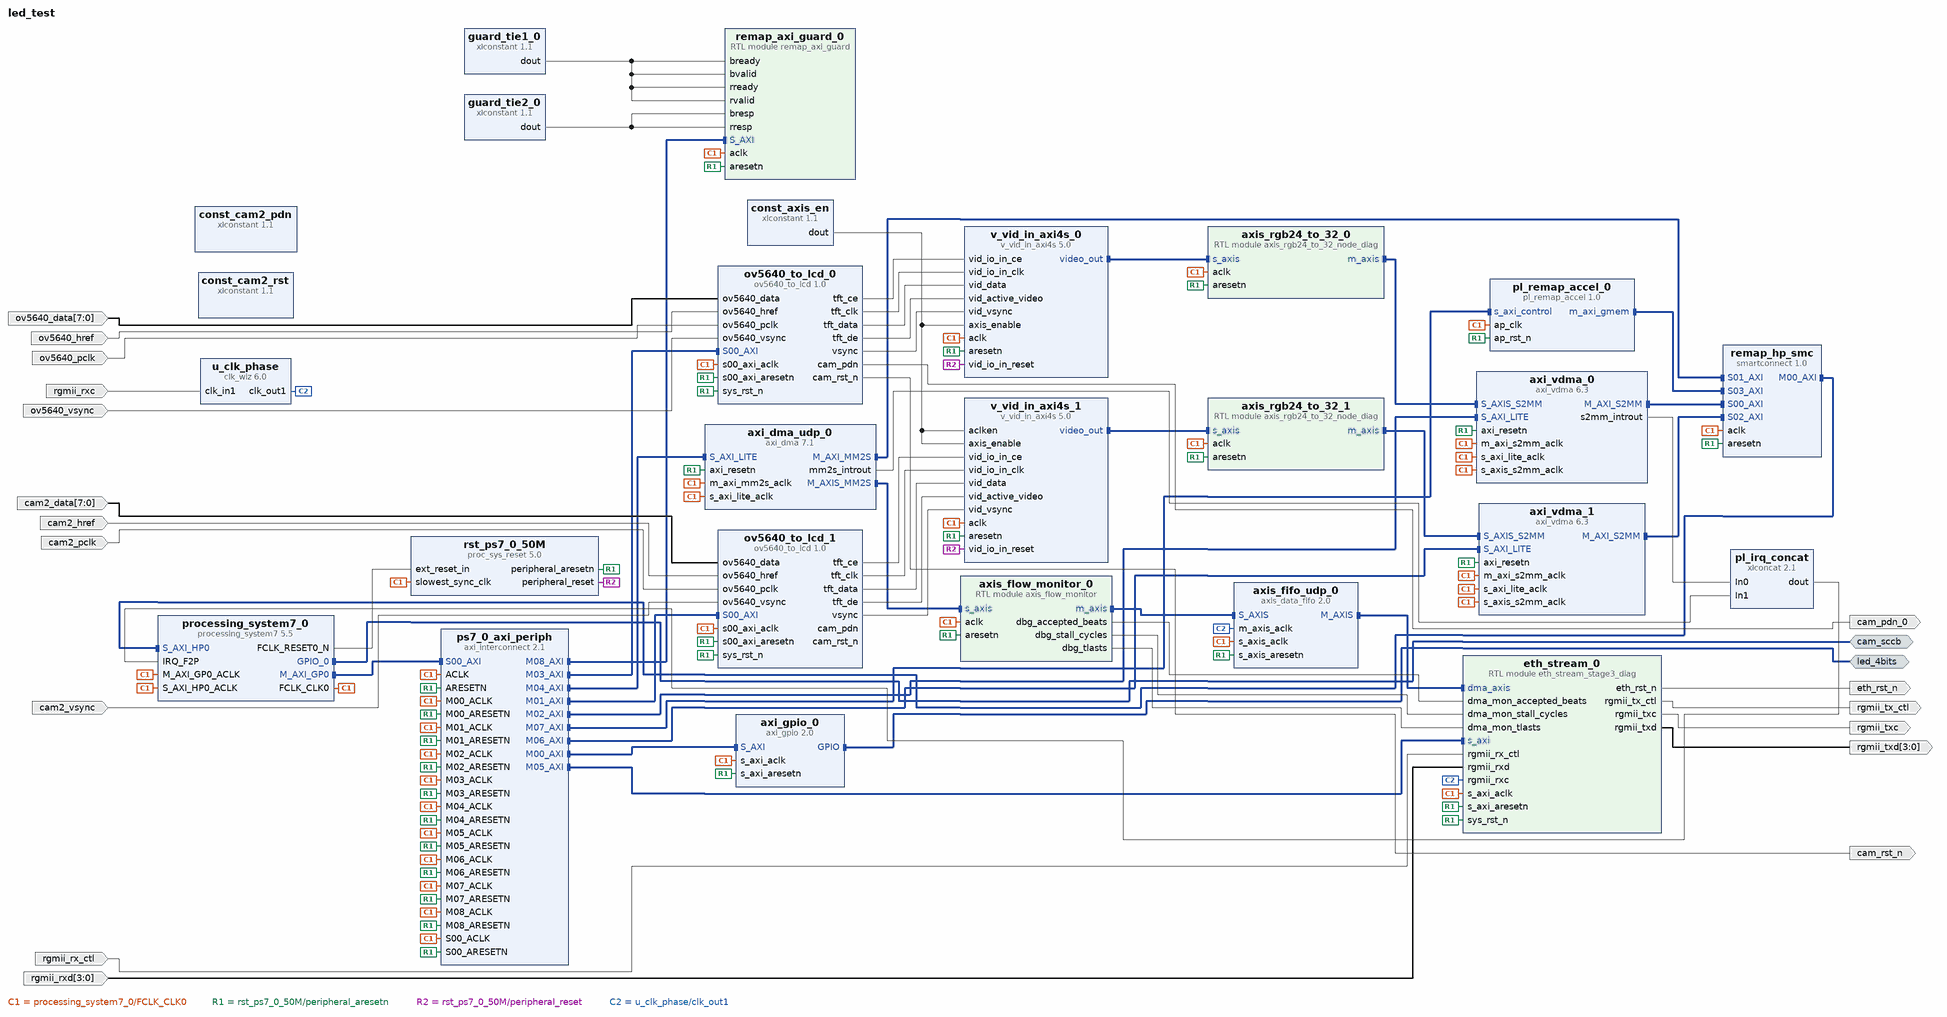
[diagram p0: block diagram of the top level]
# Vivado block design led_test, xc7z020clg400-2, Vivado 2024.1
create_bd_design led_test

create_bd_intf_port -mode Master -vlnv xilinx.com:interface:gpio_rtl:1.0 led_4bits
create_bd_intf_port -mode Master -vlnv xilinx.com:interface:gpio_rtl:1.0 cam_sccb
create_bd_port -dir I -type clk ov5640_pclk
create_bd_port -dir I ov5640_href
create_bd_port -dir I ov5640_vsync
create_bd_port -dir I -from 7 -to 0 ov5640_data
create_bd_port -dir O cam_rst_n
create_bd_port -dir O cam_pdn_0
create_bd_port -dir I -type clk rgmii_rxc
set_property -dict {CONFIG.FREQ_HZ 125000000} [get_bd_ports rgmii_rxc]
create_bd_port -dir I rgmii_rx_ctl
create_bd_port -dir I -from 3 -to 0 rgmii_rxd
create_bd_port -dir O rgmii_txc
create_bd_port -dir O rgmii_tx_ctl
create_bd_port -dir O -from 3 -to 0 rgmii_txd
create_bd_port -dir O eth_rst_n
create_bd_port -dir I -from 7 -to 0 cam2_data
create_bd_port -dir I cam2_pclk
create_bd_port -dir I cam2_vsync
create_bd_port -dir I cam2_href

create_bd_cell -type ip -vlnv xilinx.com:ip:processing_system7:5.5 processing_system7_0
set_property -dict [list \
  CONFIG.PCW_ENET0_ENET0_IO {MIO 16 .. 27} \
  CONFIG.PCW_ENET0_GRP_MDIO_ENABLE 1 \
  CONFIG.PCW_ENET0_GRP_MDIO_IO {MIO 52 .. 53} \
  CONFIG.PCW_ENET0_PERIPHERAL_ENABLE 1 \
  CONFIG.PCW_FPGA0_PERIPHERAL_FREQMHZ 100 \
  CONFIG.PCW_GPIO_EMIO_GPIO_ENABLE 1 \
  CONFIG.PCW_GPIO_EMIO_GPIO_IO 4 \
  CONFIG.PCW_GPIO_EMIO_GPIO_WIDTH 4 \
  CONFIG.PCW_GPIO_MIO_GPIO_ENABLE 0 \
  CONFIG.PCW_IRQ_F2P_INTR 1 \
  CONFIG.PCW_PRESET_BANK1_VOLTAGE {LVCMOS 1.8V} \
  CONFIG.PCW_QSPI_GRP_SINGLE_SS_ENABLE 1 \
  CONFIG.PCW_QSPI_GRP_SINGLE_SS_IO {MIO 1 .. 6} \
  CONFIG.PCW_QSPI_PERIPHERAL_ENABLE 1 \
  CONFIG.PCW_QSPI_QSPI_IO {MIO 1 .. 6} \
  CONFIG.PCW_SD0_GRP_CD_ENABLE 1 \
  CONFIG.PCW_SD0_GRP_CD_IO {MIO 12} \
  CONFIG.PCW_SD0_GRP_WP_ENABLE 0 \
  CONFIG.PCW_SD0_PERIPHERAL_ENABLE 1 \
  CONFIG.PCW_SD0_SD0_IO {MIO 40 .. 45} \
  CONFIG.PCW_SDIO_PERIPHERAL_FREQMHZ 100 \
  CONFIG.PCW_SINGLE_QSPI_DATA_MODE x4 \
  CONFIG.PCW_UART0_PERIPHERAL_ENABLE 1 \
  CONFIG.PCW_UART0_UART0_IO {MIO 14 .. 15} \
  CONFIG.PCW_UART_PERIPHERAL_FREQMHZ 100 \
  CONFIG.PCW_UIPARAM_DDR_PARTNO {MT41K256M16 RE-125} \
  CONFIG.PCW_USB0_PERIPHERAL_ENABLE 0 \
  CONFIG.PCW_USE_FABRIC_INTERRUPT 1 \
  CONFIG.PCW_USE_S_AXI_HP0 1 \
] [get_bd_cells processing_system7_0]
# 137 more settings of processing_system7_0 are not shown: defaults, MIO pin electricals, DDR timing, and values the tool derives
create_bd_cell -type ip -vlnv xilinx.com:ip:axi_gpio:2.0 axi_gpio_0
set_property -dict {CONFIG.C_ALL_OUTPUTS 1 CONFIG.C_GPIO_WIDTH 4} [get_bd_cells axi_gpio_0]
create_bd_cell -type ip -vlnv xilinx.com:ip:axi_interconnect:2.1 ps7_0_axi_periph
set_property -dict {CONFIG.NUM_MI 9} [get_bd_cells ps7_0_axi_periph]
create_bd_cell -type ip -vlnv xilinx.com:ip:proc_sys_reset:5.0 rst_ps7_0_50M
create_bd_cell -type ip -vlnv xilinx.com:ip:smartconnect:1.0 remap_hp_smc
set_property -dict {CONFIG.NUM_MI 1 CONFIG.NUM_SI 4} [get_bd_cells remap_hp_smc]
create_bd_cell -type ip -vlnv xilinx.com:user:ov5640_to_lcd:1.0 ov5640_to_lcd_0
create_bd_cell -type ip -vlnv xilinx.com:ip:v_vid_in_axi4s:5.0 v_vid_in_axi4s_0
set_property -dict {CONFIG.C_ADDR_WIDTH 12 CONFIG.C_HAS_ASYNC_CLK 1} [get_bd_cells v_vid_in_axi4s_0]
create_bd_cell -type ip -vlnv xilinx.com:ip:xlconstant:1.1 const_axis_en
set_property -dict {CONFIG.CONST_VAL 1 CONFIG.CONST_WIDTH 1} [get_bd_cells const_axis_en]
create_bd_cell -type ip -vlnv xilinx.com:ip:axi_vdma:6.3 axi_vdma_0
set_property -dict [list \
  CONFIG.c_include_internal_genlock 0 \
  CONFIG.c_include_mm2s 0 \
  CONFIG.c_include_s2mm 1 \
  CONFIG.c_num_fstores 3 \
  CONFIG.c_s2mm_genlock_mode 0 \
  CONFIG.c_s2mm_genlock_repeat_en 0 \
  CONFIG.c_s2mm_linebuffer_depth 2048 \
  CONFIG.c_s2mm_max_burst_length 64 \
] [get_bd_cells axi_vdma_0]
create_bd_cell -type ip -vlnv xilinx.com:ip:axi_dma:7.1 axi_dma_udp_0
set_property -dict [list \
  CONFIG.c_include_mm2s 1 \
  CONFIG.c_include_s2mm 0 \
  CONFIG.c_include_sg 0 \
  CONFIG.c_m_axi_mm2s_data_width 64 \
  CONFIG.c_m_axis_mm2s_tdata_width 64 \
  CONFIG.c_sg_length_width 23 \
] [get_bd_cells axi_dma_udp_0]
create_bd_cell -type module -reference axis_flow_monitor axis_flow_monitor_0
create_bd_cell -type ip -vlnv xilinx.com:ip:axis_data_fifo:2.0 axis_fifo_udp_0
set_property -dict [list \
  CONFIG.FIFO_DEPTH 2048 \
  CONFIG.HAS_TKEEP 1 \
  CONFIG.HAS_TLAST 1 \
  CONFIG.IS_ACLK_ASYNC 1 \
  CONFIG.TDATA_NUM_BYTES 8 \
] [get_bd_cells axis_fifo_udp_0]
create_bd_cell -type module -reference eth_stream_stage3_diag eth_stream_0
create_bd_cell -type ip -vlnv xilinx.com:ip:clk_wiz:6.0 u_clk_phase
set_property -dict [list \
  CONFIG.CLKOUT1_REQUESTED_OUT_FREQ 125 \
  CONFIG.CLKOUT1_REQUESTED_PHASE 0.0 \
  CONFIG.PRIM_IN_FREQ 125 \
  CONFIG.USE_LOCKED false \
  CONFIG.USE_RESET false \
] [get_bd_cells u_clk_phase]
create_bd_cell -type ip -vlnv xilinx.com:ip:xlconcat:2.1 pl_irq_concat
set_property -dict {CONFIG.NUM_PORTS 2} [get_bd_cells pl_irq_concat]
create_bd_cell -type module -reference axis_rgb24_to_32_node_diag axis_rgb24_to_32_0
create_bd_cell -type ip -vlnv xilinx.com:user:ov5640_to_lcd:1.0 ov5640_to_lcd_1
create_bd_cell -type ip -vlnv xilinx.com:ip:v_vid_in_axi4s:5.0 v_vid_in_axi4s_1
set_property -dict {CONFIG.C_HAS_ASYNC_CLK 1} [get_bd_cells v_vid_in_axi4s_1]
create_bd_cell -type ip -vlnv xilinx.com:ip:axi_vdma:6.3 axi_vdma_1
set_property -dict [list \
  CONFIG.c_include_internal_genlock 0 \
  CONFIG.c_include_mm2s 0 \
  CONFIG.c_include_s2mm 1 \
  CONFIG.c_num_fstores 3 \
  CONFIG.c_s2mm_genlock_mode 0 \
  CONFIG.c_s2mm_genlock_repeat_en 0 \
  CONFIG.c_s2mm_linebuffer_depth 2048 \
  CONFIG.c_s2mm_max_burst_length 64 \
] [get_bd_cells axi_vdma_1]
create_bd_cell -type ip -vlnv xilinx.com:ip:xlconstant:1.1 const_cam2_rst
set_property -dict {CONFIG.CONST_VAL 1 CONFIG.CONST_WIDTH 1} [get_bd_cells const_cam2_rst]
create_bd_cell -type ip -vlnv xilinx.com:ip:xlconstant:1.1 const_cam2_pdn
set_property -dict {CONFIG.CONST_VAL 0 CONFIG.CONST_WIDTH 1} [get_bd_cells const_cam2_pdn]
create_bd_cell -type module -reference axis_rgb24_to_32_node_diag axis_rgb24_to_32_1
create_bd_cell -type ip -vlnv xilinx.com:hls:pl_remap_accel:1.0 pl_remap_accel_0
create_bd_cell -type module -reference remap_axi_guard remap_axi_guard_0
create_bd_cell -type ip -vlnv xilinx.com:ip:xlconstant:1.1 guard_tie1_0
set_property -dict {CONFIG.CONST_VAL 0 CONFIG.CONST_WIDTH 1} [get_bd_cells guard_tie1_0]
create_bd_cell -type ip -vlnv xilinx.com:ip:xlconstant:1.1 guard_tie2_0
set_property -dict {CONFIG.CONST_VAL 0 CONFIG.CONST_WIDTH 2} [get_bd_cells guard_tie2_0]

# ---- connections ----

connect_bd_intf_net [get_bd_intf_pins axi_dma_udp_0/M_AXIS_MM2S] [get_bd_intf_pins axis_flow_monitor_0/s_axis]
connect_bd_intf_net [get_bd_intf_pins axi_dma_udp_0/M_AXI_MM2S] [get_bd_intf_pins remap_hp_smc/S01_AXI]
connect_bd_intf_net [get_bd_intf_ports led_4bits] [get_bd_intf_pins axi_gpio_0/GPIO]
connect_bd_intf_net [get_bd_intf_pins axi_vdma_0/M_AXI_S2MM] [get_bd_intf_pins remap_hp_smc/S00_AXI]
connect_bd_intf_net [get_bd_intf_pins axis_fifo_udp_0/M_AXIS] [get_bd_intf_pins eth_stream_0/dma_axis]
connect_bd_intf_net [get_bd_intf_pins axis_flow_monitor_0/m_axis] [get_bd_intf_pins axis_fifo_udp_0/S_AXIS]
connect_bd_intf_net [get_bd_intf_pins axis_rgb24_to_32_0/m_axis] [get_bd_intf_pins axi_vdma_0/S_AXIS_S2MM]
connect_bd_intf_net [get_bd_intf_pins axis_rgb24_to_32_1/m_axis] [get_bd_intf_pins axi_vdma_1/S_AXIS_S2MM]
connect_bd_intf_net [get_bd_intf_pins pl_remap_accel_0/m_axi_gmem] [get_bd_intf_pins remap_hp_smc/S03_AXI]
connect_bd_intf_net [get_bd_intf_ports cam_sccb] [get_bd_intf_pins processing_system7_0/GPIO_0]
connect_bd_intf_net [get_bd_intf_pins processing_system7_0/M_AXI_GP0] [get_bd_intf_pins ps7_0_axi_periph/S00_AXI]
connect_bd_intf_net [get_bd_intf_pins ps7_0_axi_periph/M00_AXI] [get_bd_intf_pins axi_gpio_0/S_AXI]
connect_bd_intf_net [get_bd_intf_pins ov5640_to_lcd_1/S00_AXI] [get_bd_intf_pins ps7_0_axi_periph/M01_AXI]
connect_bd_intf_net [get_bd_intf_pins ps7_0_axi_periph/M02_AXI] [get_bd_intf_pins axi_vdma_0/S_AXI_LITE]
connect_bd_intf_net [get_bd_intf_pins ps7_0_axi_periph/M03_AXI] [get_bd_intf_pins ov5640_to_lcd_0/S00_AXI]
connect_bd_intf_net [get_bd_intf_pins ps7_0_axi_periph/M04_AXI] [get_bd_intf_pins axi_dma_udp_0/S_AXI_LITE]
connect_bd_intf_net [get_bd_intf_pins ps7_0_axi_periph/M05_AXI] [get_bd_intf_pins eth_stream_0/s_axi]
connect_bd_intf_net [get_bd_intf_pins axi_vdma_1/S_AXI_LITE] [get_bd_intf_pins ps7_0_axi_periph/M06_AXI]
connect_bd_intf_net [get_bd_intf_pins ps7_0_axi_periph/M07_AXI] [get_bd_intf_pins pl_remap_accel_0/s_axi_control]
connect_bd_intf_net [get_bd_intf_pins ps7_0_axi_periph/M08_AXI] [get_bd_intf_pins remap_axi_guard_0/S_AXI]
connect_bd_intf_net -intf_net remap_accel_0_m_axi_gmem2 [get_bd_intf_pins axi_vdma_1/M_AXI_S2MM] [get_bd_intf_pins remap_hp_smc/S02_AXI]
connect_bd_intf_net [get_bd_intf_pins remap_hp_smc/M00_AXI] [get_bd_intf_pins processing_system7_0/S_AXI_HP0]
connect_bd_intf_net [get_bd_intf_pins v_vid_in_axi4s_0/video_out] [get_bd_intf_pins axis_rgb24_to_32_0/s_axis]
connect_bd_intf_net [get_bd_intf_pins v_vid_in_axi4s_1/video_out] [get_bd_intf_pins axis_rgb24_to_32_1/s_axis]
connect_bd_net [get_bd_pins axi_dma_udp_0/mm2s_introut] [get_bd_pins pl_irq_concat/In1]
connect_bd_net [get_bd_pins axi_vdma_0/s2mm_introut] [get_bd_pins pl_irq_concat/In0]
connect_bd_net [get_bd_pins axis_flow_monitor_0/dbg_accepted_beats] [get_bd_pins eth_stream_0/dma_mon_accepted_beats]
connect_bd_net [get_bd_pins axis_flow_monitor_0/dbg_stall_cycles] [get_bd_pins eth_stream_0/dma_mon_stall_cycles]
connect_bd_net [get_bd_pins axis_flow_monitor_0/dbg_tlasts] [get_bd_pins eth_stream_0/dma_mon_tlasts]
connect_bd_net [get_bd_ports cam2_data] [get_bd_pins ov5640_to_lcd_1/ov5640_data]
connect_bd_net [get_bd_ports cam2_href] [get_bd_pins ov5640_to_lcd_1/ov5640_href]
connect_bd_net [get_bd_ports cam2_pclk] [get_bd_pins ov5640_to_lcd_1/ov5640_pclk]
connect_bd_net [get_bd_ports cam2_vsync] [get_bd_pins ov5640_to_lcd_1/ov5640_vsync]
connect_bd_net [get_bd_pins const_axis_en/dout] \
  [get_bd_pins v_vid_in_axi4s_0/axis_enable] [get_bd_pins v_vid_in_axi4s_1/axis_enable] [get_bd_pins v_vid_in_axi4s_1/aclken]
connect_bd_net [get_bd_pins eth_stream_0/eth_rst_n] [get_bd_ports eth_rst_n]
connect_bd_net [get_bd_pins eth_stream_0/rgmii_tx_ctl] [get_bd_ports rgmii_tx_ctl]
connect_bd_net [get_bd_pins eth_stream_0/rgmii_txc] [get_bd_ports rgmii_txc]
connect_bd_net [get_bd_pins eth_stream_0/rgmii_txd] [get_bd_ports rgmii_txd]
connect_bd_net [get_bd_pins guard_tie1_0/dout] \
  [get_bd_pins remap_axi_guard_0/rvalid] [get_bd_pins remap_axi_guard_0/rready] [get_bd_pins remap_axi_guard_0/bvalid] \
  [get_bd_pins remap_axi_guard_0/bready]
connect_bd_net [get_bd_pins guard_tie2_0/dout] [get_bd_pins remap_axi_guard_0/rresp] [get_bd_pins remap_axi_guard_0/bresp]
connect_bd_net [get_bd_ports ov5640_data] [get_bd_pins ov5640_to_lcd_0/ov5640_data]
connect_bd_net [get_bd_ports ov5640_href] [get_bd_pins ov5640_to_lcd_0/ov5640_href]
connect_bd_net [get_bd_ports ov5640_pclk] [get_bd_pins ov5640_to_lcd_0/ov5640_pclk]
connect_bd_net [get_bd_pins ov5640_to_lcd_0/cam_pdn] [get_bd_ports cam_pdn_0]
connect_bd_net [get_bd_pins ov5640_to_lcd_0/cam_rst_n] [get_bd_ports cam_rst_n]
connect_bd_net [get_bd_pins ov5640_to_lcd_0/tft_ce] [get_bd_pins v_vid_in_axi4s_0/vid_io_in_ce]
connect_bd_net [get_bd_pins ov5640_to_lcd_0/tft_clk] [get_bd_pins v_vid_in_axi4s_0/vid_io_in_clk]
connect_bd_net [get_bd_pins ov5640_to_lcd_0/tft_data] [get_bd_pins v_vid_in_axi4s_0/vid_data]
connect_bd_net [get_bd_pins ov5640_to_lcd_0/tft_de] [get_bd_pins v_vid_in_axi4s_0/vid_active_video]
connect_bd_net [get_bd_pins ov5640_to_lcd_0/vsync] [get_bd_pins v_vid_in_axi4s_0/vid_vsync]
# net ov5640_to_lcd_1_cam_pdn has one end: ov5640_to_lcd_1/cam_pdn
# net ov5640_to_lcd_1_cam_rst_n has one end: ov5640_to_lcd_1/cam_rst_n
connect_bd_net [get_bd_pins ov5640_to_lcd_1/tft_ce] [get_bd_pins v_vid_in_axi4s_1/vid_io_in_ce]
connect_bd_net [get_bd_pins ov5640_to_lcd_1/tft_clk] [get_bd_pins v_vid_in_axi4s_1/vid_io_in_clk]
connect_bd_net [get_bd_pins ov5640_to_lcd_1/tft_data] [get_bd_pins v_vid_in_axi4s_1/vid_data]
connect_bd_net [get_bd_pins ov5640_to_lcd_1/tft_de] [get_bd_pins v_vid_in_axi4s_1/vid_active_video]
connect_bd_net [get_bd_pins ov5640_to_lcd_1/vsync] [get_bd_pins v_vid_in_axi4s_1/vid_vsync]
connect_bd_net [get_bd_ports ov5640_vsync] [get_bd_pins ov5640_to_lcd_0/ov5640_vsync]
connect_bd_net [get_bd_pins pl_irq_concat/dout] [get_bd_pins processing_system7_0/IRQ_F2P]
connect_bd_net [get_bd_pins processing_system7_0/FCLK_CLK0] \
  [get_bd_pins processing_system7_0/M_AXI_GP0_ACLK] [get_bd_pins ps7_0_axi_periph/S00_ACLK] \
  [get_bd_pins rst_ps7_0_50M/slowest_sync_clk] [get_bd_pins axi_gpio_0/s_axi_aclk] [get_bd_pins ps7_0_axi_periph/M00_ACLK] \
  [get_bd_pins ps7_0_axi_periph/ACLK] [get_bd_pins processing_system7_0/S_AXI_HP0_ACLK] [get_bd_pins remap_hp_smc/aclk] \
  [get_bd_pins ps7_0_axi_periph/M01_ACLK] [get_bd_pins v_vid_in_axi4s_0/aclk] [get_bd_pins axi_vdma_0/s_axi_lite_aclk] \
  [get_bd_pins axi_vdma_0/m_axi_s2mm_aclk] [get_bd_pins axi_vdma_0/s_axis_s2mm_aclk] [get_bd_pins ps7_0_axi_periph/M02_ACLK] \
  [get_bd_pins ps7_0_axi_periph/M03_ACLK] [get_bd_pins ov5640_to_lcd_0/s00_axi_aclk] \
  [get_bd_pins axi_dma_udp_0/s_axi_lite_aclk] [get_bd_pins axi_dma_udp_0/m_axi_mm2s_aclk] \
  [get_bd_pins axis_flow_monitor_0/aclk] [get_bd_pins axis_fifo_udp_0/s_axis_aclk] [get_bd_pins eth_stream_0/s_axi_aclk] \
  [get_bd_pins ps7_0_axi_periph/M04_ACLK] [get_bd_pins ps7_0_axi_periph/M05_ACLK] [get_bd_pins axis_rgb24_to_32_0/aclk] \
  [get_bd_pins axi_vdma_1/s_axi_lite_aclk] [get_bd_pins axi_vdma_1/m_axi_s2mm_aclk] [get_bd_pins axi_vdma_1/s_axis_s2mm_aclk] \
  [get_bd_pins v_vid_in_axi4s_1/aclk] [get_bd_pins ov5640_to_lcd_1/s00_axi_aclk] [get_bd_pins ps7_0_axi_periph/M06_ACLK] \
  [get_bd_pins axis_rgb24_to_32_1/aclk] [get_bd_pins pl_remap_accel_0/ap_clk] [get_bd_pins remap_axi_guard_0/aclk] \
  [get_bd_pins ps7_0_axi_periph/M07_ACLK] [get_bd_pins ps7_0_axi_periph/M08_ACLK]
connect_bd_net [get_bd_pins processing_system7_0/FCLK_RESET0_N] [get_bd_pins rst_ps7_0_50M/ext_reset_in]
connect_bd_net [get_bd_ports rgmii_rx_ctl] [get_bd_pins eth_stream_0/rgmii_rx_ctl]
connect_bd_net [get_bd_ports rgmii_rxc] [get_bd_pins u_clk_phase/clk_in1]
connect_bd_net [get_bd_ports rgmii_rxd] [get_bd_pins eth_stream_0/rgmii_rxd]
connect_bd_net [get_bd_pins rst_ps7_0_50M/peripheral_aresetn] \
  [get_bd_pins ps7_0_axi_periph/S00_ARESETN] [get_bd_pins axi_gpio_0/s_axi_aresetn] \
  [get_bd_pins ps7_0_axi_periph/M00_ARESETN] [get_bd_pins ps7_0_axi_periph/ARESETN] [get_bd_pins remap_hp_smc/aresetn] \
  [get_bd_pins ps7_0_axi_periph/M01_ARESETN] [get_bd_pins v_vid_in_axi4s_0/aresetn] [get_bd_pins axi_vdma_0/axi_resetn] \
  [get_bd_pins ps7_0_axi_periph/M02_ARESETN] [get_bd_pins ps7_0_axi_periph/M03_ARESETN] \
  [get_bd_pins ov5640_to_lcd_0/s00_axi_aresetn] [get_bd_pins ov5640_to_lcd_0/sys_rst_n] \
  [get_bd_pins axi_dma_udp_0/axi_resetn] [get_bd_pins axis_flow_monitor_0/aresetn] \
  [get_bd_pins axis_fifo_udp_0/s_axis_aresetn] [get_bd_pins eth_stream_0/s_axi_aresetn] [get_bd_pins eth_stream_0/sys_rst_n] \
  [get_bd_pins ps7_0_axi_periph/M04_ARESETN] [get_bd_pins ps7_0_axi_periph/M05_ARESETN] \
  [get_bd_pins axis_rgb24_to_32_0/aresetn] [get_bd_pins axi_vdma_1/axi_resetn] [get_bd_pins v_vid_in_axi4s_1/aresetn] \
  [get_bd_pins ov5640_to_lcd_1/s00_axi_aresetn] [get_bd_pins ps7_0_axi_periph/M06_ARESETN] \
  [get_bd_pins ov5640_to_lcd_1/sys_rst_n] [get_bd_pins axis_rgb24_to_32_1/aresetn] [get_bd_pins pl_remap_accel_0/ap_rst_n] \
  [get_bd_pins remap_axi_guard_0/aresetn] [get_bd_pins ps7_0_axi_periph/M07_ARESETN] \
  [get_bd_pins ps7_0_axi_periph/M08_ARESETN]
connect_bd_net [get_bd_pins rst_ps7_0_50M/peripheral_reset] \
  [get_bd_pins v_vid_in_axi4s_0/vid_io_in_reset] [get_bd_pins v_vid_in_axi4s_1/vid_io_in_reset]
connect_bd_net [get_bd_pins u_clk_phase/clk_out1] [get_bd_pins eth_stream_0/rgmii_rxc] [get_bd_pins axis_fifo_udp_0/m_axis_aclk]

# ---- address map ----
assign_bd_address -offset 0x00000000 -range 1G -target_address_space [get_bd_addr_spaces axi_dma_udp_0/Data_MM2S] [get_bd_addr_segs processing_system7_0/S_AXI_HP0/HP0_DDR_LOWOCM]
assign_bd_address -offset 0x00000000 -range 1G -target_address_space [get_bd_addr_spaces axi_vdma_0/Data_S2MM] [get_bd_addr_segs processing_system7_0/S_AXI_HP0/HP0_DDR_LOWOCM]
assign_bd_address -offset 0x00000000 -range 1G -target_address_space [get_bd_addr_spaces axi_vdma_1/Data_S2MM] [get_bd_addr_segs processing_system7_0/S_AXI_HP0/HP0_DDR_LOWOCM]
assign_bd_address -offset 0x0000000000000000 -range 1G -target_address_space [get_bd_addr_spaces pl_remap_accel_0/Data_m_axi_gmem] [get_bd_addr_segs processing_system7_0/S_AXI_HP0/HP0_DDR_LOWOCM]
assign_bd_address -offset 0x40000000 -range 64K -target_address_space [get_bd_addr_spaces processing_system7_0/Data] [get_bd_addr_segs pl_remap_accel_0/s_axi_control/Reg]
assign_bd_address -offset 0x40010000 -range 4K -target_address_space [get_bd_addr_spaces processing_system7_0/Data] [get_bd_addr_segs eth_stream_0/s_axi/reg0]
assign_bd_address -offset 0x40020000 -range 64K -target_address_space [get_bd_addr_spaces processing_system7_0/Data] [get_bd_addr_segs remap_axi_guard_0/S_AXI/reg0]
assign_bd_address -offset 0x41200000 -range 64K -target_address_space [get_bd_addr_spaces processing_system7_0/Data] [get_bd_addr_segs axi_gpio_0/S_AXI/Reg]
assign_bd_address -offset 0x41E00000 -range 64K -target_address_space [get_bd_addr_spaces processing_system7_0/Data] [get_bd_addr_segs axi_dma_udp_0/S_AXI_LITE/Reg]
assign_bd_address -offset 0x43000000 -range 64K -target_address_space [get_bd_addr_spaces processing_system7_0/Data] [get_bd_addr_segs axi_vdma_1/S_AXI_LITE/Reg]
assign_bd_address -offset 0x43C00000 -range 64K -target_address_space [get_bd_addr_spaces processing_system7_0/Data] [get_bd_addr_segs ov5640_to_lcd_1/S00_AXI/S00_AXI_reg]
assign_bd_address -offset 0x44A00000 -range 64K -target_address_space [get_bd_addr_spaces processing_system7_0/Data] [get_bd_addr_segs axi_vdma_0/S_AXI_LITE/Reg]
assign_bd_address -offset 0x44A10000 -range 64K -target_address_space [get_bd_addr_spaces processing_system7_0/Data] [get_bd_addr_segs ov5640_to_lcd_0/S00_AXI/S00_AXI_reg]

validate_bd_design
save_bd_design
